# Altium schematic sheet Owens Test Node.SchDoc
size A; SheetNumber: 1; SheetTotal: 3
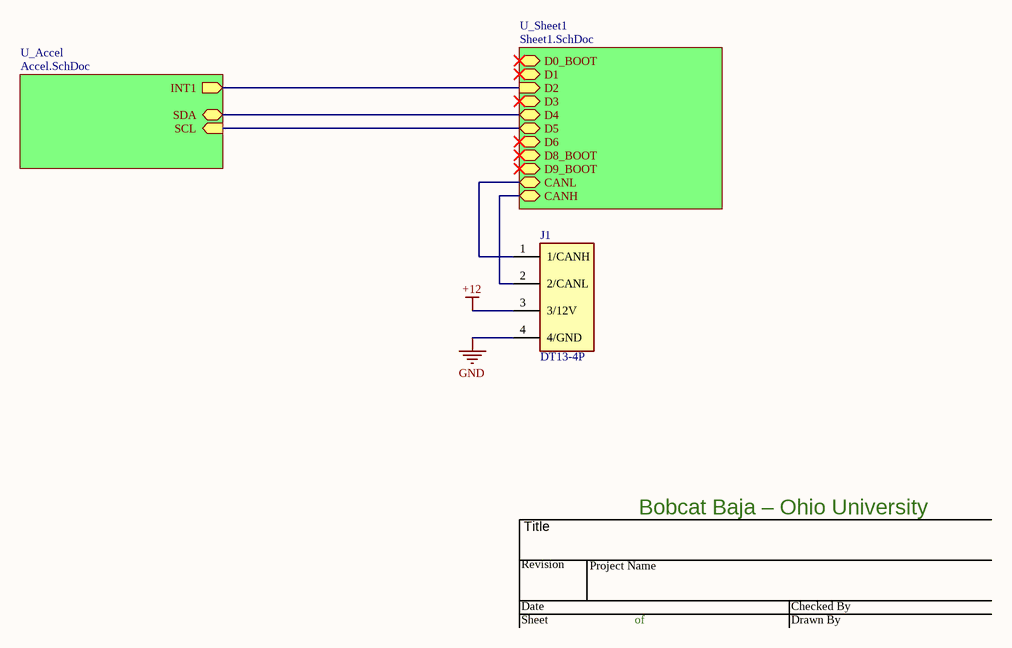
[diagram p0: Owens Test Node.SchDoc]

## Parts
J1  DT13-4P  [TE_DT13-4P]

## Sub-sheets
U_Accel = Accel.SchDoc: INT1 (out), SDA (bidir), SCL (in)
U_Sheet1 = Sheet1.SchDoc: D0_BOOT (bidir), D1 (bidir), D2 (in), D3 (bidir), D4 (bidir), D5 (bidir), D6 (bidir), D8_BOOT (bidir), D9_BOOT (bidir), CANL (bidir), CANH (bidir)

## Nets
+12: J1.3(3/12V)
GND: J1.4(4/GND)
NetJ1_1: J1.1(1/CANH) ; sheet U_Sheet1/CANL
NetJ1_2: J1.2(2/CANL) ; sheet U_Sheet1/CANH
(unnamed): sheet U_Accel/INT1, sheet U_Sheet1/D2
(unnamed): sheet U_Accel/SDA, sheet U_Sheet1/D4
(unnamed): sheet U_Accel/SCL, sheet U_Sheet1/D5

## Notes on the sheet
- Title
- Bobcat Baja – Ohio University
- Revision
- Date
- Project Name
- Checked By
- Sheet
- of
- Drawn By

## Library data of the parts
J1 = CMP-002-00095-3: DT13 Series 4.44mm Pitch 4 Way 2 Row Right Angle PCB Header Solder Termination; MF: TE Connectivity; Design Item ID: DT13-4P; EU_RoHS_Compliance: Compliant; SnapEDA_Link: https://www.snapeda.com/parts/DT13-4P/TE+Connectivity+%252F+DEUTSCH/view-part/?ref=snap; Check_prices: https://www.snapeda.com/parts/DT13-4P/TE+Connectivity+%252F+DEUTSCH/view-part/?ref=eda; Component Type: Standard; MP: DT13-4P; Pins: 4; Source: DT13-4P.SchLib; Case/Package: None; Value: *